# EAGLE design klavesnica (EAGLE 9.6.2)
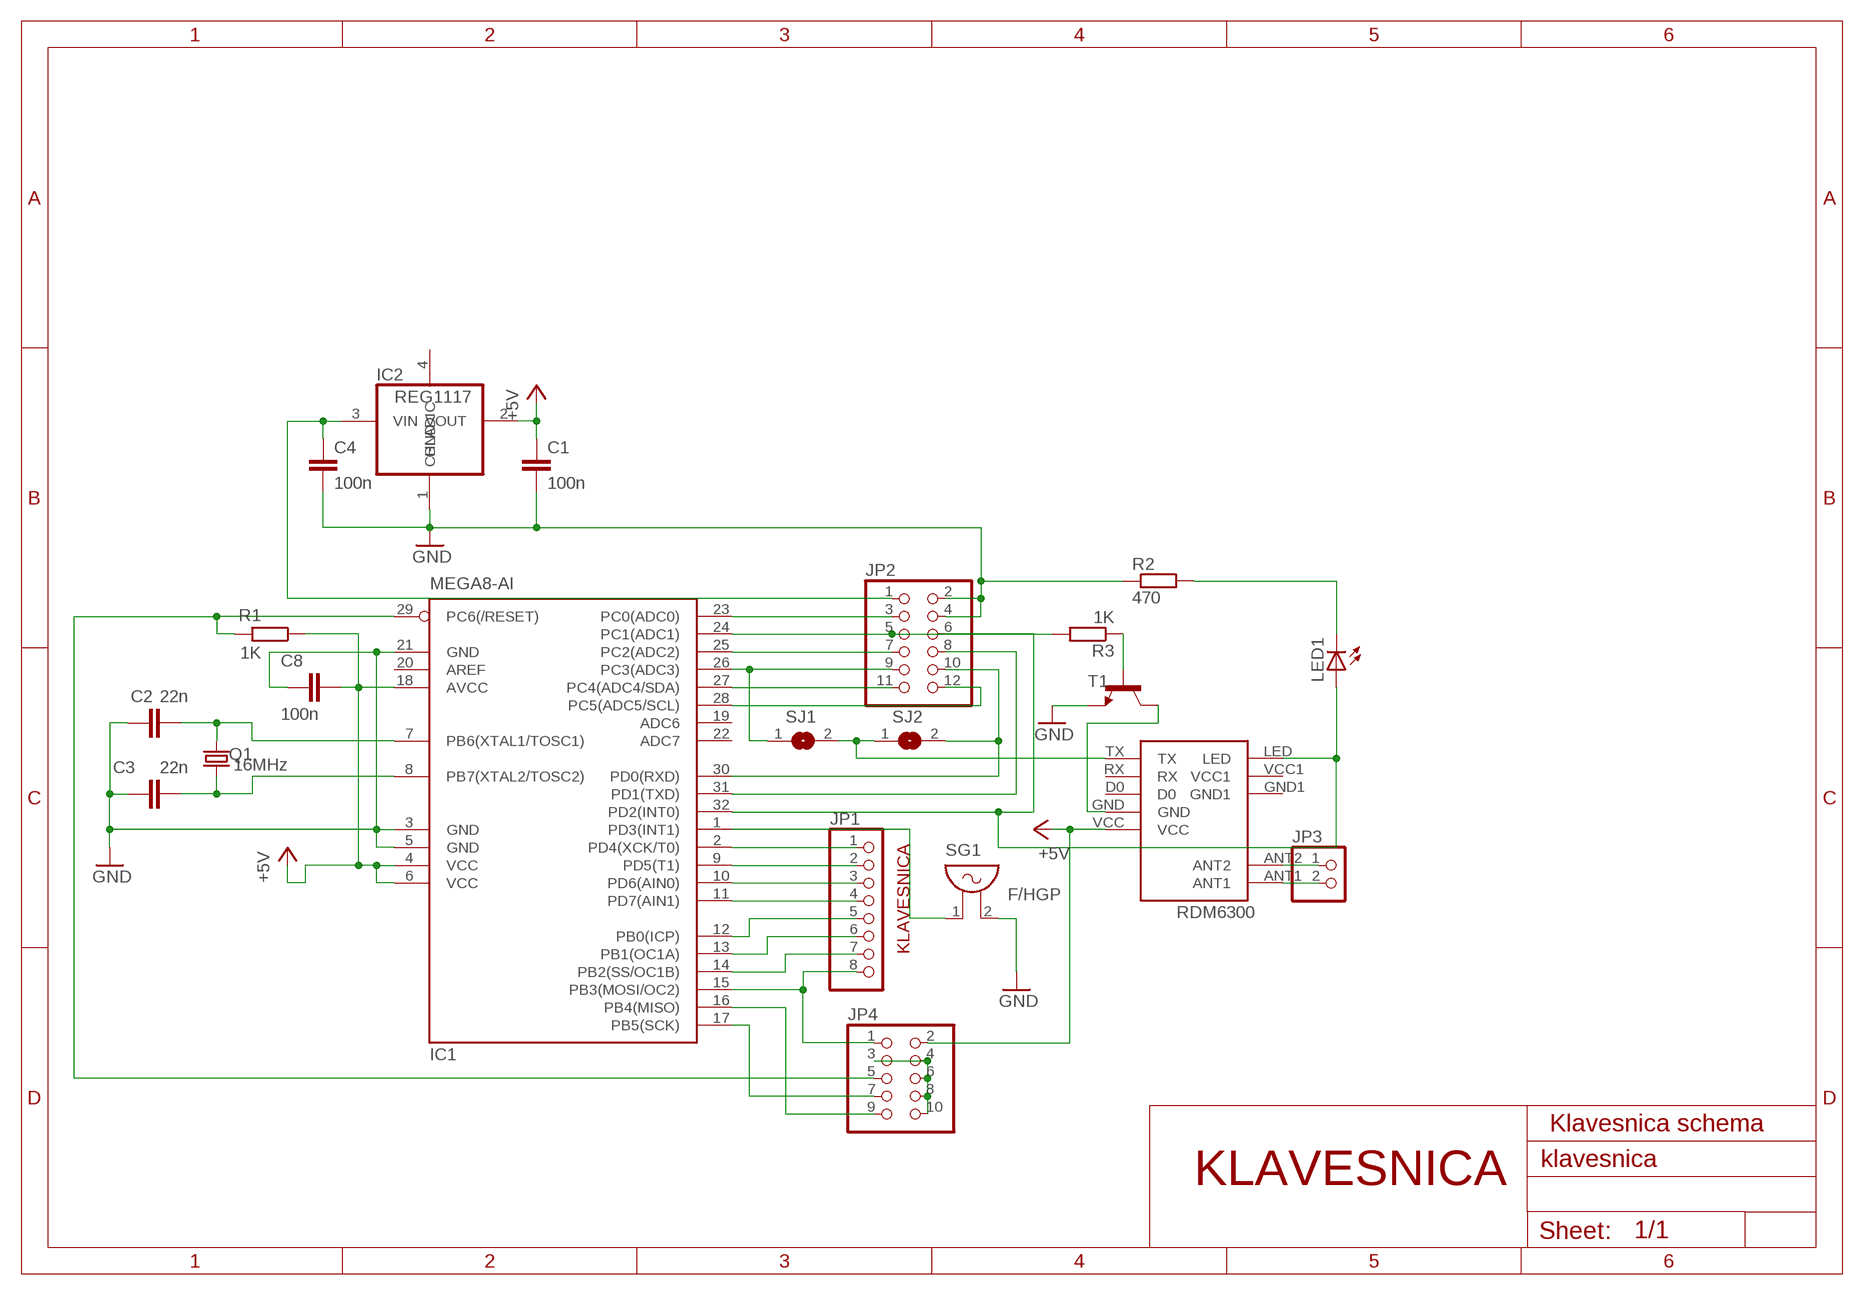
[diagram p0: schematic, sheet 1]

## Parts
C1  100n  C-EUC0805  [C0805]
C2  22n  C-EUC0805  [C0805]
C3  22n  C-EUC0805  [C0805]
C4  100n  C-EUC0805  [C0805]
C8  100n  C-EUC0805  [C0805]
IC1  MEGA8-AI  [TQFP32-08]
IC2  REG1117  [SOT223]
JP1  PINHD-1X8  [1X08]
JP2  PINHD-2X6  [2X06]
JP3  PINHD-1X2  [1X02]
JP4  PINHD-2X5  [2X05]
LED1  LED3MM  [LED3MM]
Q1  16MHz  CRYSTALHC49UP  [HC49UP]
R1  1K  R-EU_R0805  [R0805]
R2  470  R-EU_R0805  [R0805]
R3  1K  R-EU_R0805  [R0805]
RDM1  RDM6300  [RDM6300]
SG1  F/HGP  [F/HGP]
SJ1  SJ  [SJ]
SJ2  SJ  [SJ]
T1  BC808-NPN-SOT23-BEC  [SOT23-BEC]

## Nets
+5V: C1.1 C8.1 IC1.4(VCC) IC1.6(VCC) IC1.18(AVCC) IC2.2(VOUT) JP4.2 R1.1 RDM1.VCC
GND: C1.2 C2.1 C3.1 C4.2 C8.2 IC1.3(GND) IC1.5(GND) IC1.21(GND) IC2.1(GND) JP2.2 JP2.4 R2.1 SG1.2 T1.E
N$1: IC1.29(PC6(/RESET)) JP4.5 R1.2
N$2: IC1.2(PD4(XCK/T0)) JP1.1
N$3: IC1.9(PD5(T1)) JP1.2
N$4: IC1.10(PD6(AIN0)) JP1.3
N$5: IC1.11(PD7(AIN1)) JP1.4
N$6: IC1.12(PB0(ICP)) JP1.5
N$7: IC1.13(PB1(OC1A)) JP1.6
N$8: IC1.14(PB2(SS/OC1B)) JP1.7
N$9: C3.2 IC1.8(PB7(XTAL2/TOSC2)) Q1.1
N$10: C4.1 IC2.3(VIN) JP2.1
N$11: LED1.K(C) R2.2
N$12: C2.2 IC1.7(PB6(XTAL1/TOSC1)) Q1.2
N$13: IC1.23(PC0(ADC0)) JP2.3
N$14: IC1.24(PC1(ADC1)) JP2.5 R3.2
N$15: IC1.25(PC2(ADC2)) JP2.7
N$16: IC1.26(PC3(ADC3)) JP2.9 SJ1.1
N$17: IC1.27(PC4(ADC4/SDA)) JP2.11
N$18: IC1.28(PC5(ADC5/SCL)) JP2.12
N$19: IC1.30(PD0(RXD)) JP2.10 SJ2.2
N$20: IC1.31(PD1(TXD)) JP2.8
N$21: IC1.1(PD3(INT1)) SG1.1
N$22: JP3.1 RDM1.ANT2
N$23: JP3.2 RDM1.ANT1
N$24: JP4.3 JP4.4 JP4.6 JP4.8 JP4.10
N$25: IC1.32(PD2(INT0)) JP2.6 LED1.A RDM1.LED
N$26: IC1.16(PB4(MISO)) JP4.9
N$27: IC1.17(PB5(SCK)) JP4.7
N$28: RDM1.GND T1.C
N$29: IC1.15(PB3(MOSI/OC2)) JP1.8 JP4.1
N$30: R3.1 T1.B
N$31: RDM1.TX SJ1.2 SJ2.1
Unconnected: IC1.19(ADC6) IC1.20(AREF) IC1.22(ADC7) RDM1.D0 RDM1.GND1 RDM1.RX RDM1.VCC1

## Notes on the sheet
- KLAVESNICA
- Klavesnica schema
- KLAVESNICA

## Power pins joined to a net without a drawn wire
CHLADIC: IC2.4(CHLADIC)

## Library data of the parts
C1-C4 C8 = rcl:C-EU: CAPACITOR, European symbol; SPICEPREFIX: C
IC1 = atmel:MEGA8: MICROCONTROLLER 8 Kbytes FLASH, 1 kbytes SRAM, 512 bytes EEPROM, USART, 6-channel 10 bit ADC, 2-channel 8 bit ADC Pin compatible with Atmega48, ATMega88, ATMega168 Source: avr.lbr; MPN: ATMEGA8-16AU; OC_FARNELL: 9171371; OC_NEWARK: 73M8863
IC2 = burr-brown:REG1117: 800mA and 1A Low Dropout (LDO) Positive Regulator 1.8V, 2.5V, 2.85V, 3.3V, 5V, and Adj; MPN: REG1117; OC_FARNELL: 1097566; OC_NEWARK: 14P6981
JP1 = pinhead:PINHD-1X8: PIN HEADER
JP2 = pinhead:PINHD-2X6: PIN HEADER
JP3 = pinhead:PINHD-1X2: PIN HEADER
JP4 = pinhead:PINHD-2X5: PIN HEADER
LED1 = adafruit:LED: LED OSRAM: - CHIPLED LG R971, LG N971, LY N971, LG Q971, LY Q971, LO R971, LY R971 LH N974, LH R974 LS Q976, LO Q976, LY Q976 LO Q996 - Hyper CHIPLED LW Q18S LB Q993, LB Q99A, LB R99A - SideLED LS A670, LO A670, LY A670, LG A670, LP A670 LB A673, LV A673, LT A673, LW A673 LH A674 LY A675 LS A676, LA A676, LO A676, LY A676, LW A676 LS A679, LY A679, LG A679 - Hyper Micro SIDELED® LS Y876, LA Y876, LO Y876, LY Y876 LT Y87S - SmartLED LW L88C, LW L88S LB L89C, LB L89S, LG L890 LS L89K, LO L89K, LY L89K LS L896, LA L896, LO L896, LY L896 - TOPLED LS T670, LO T670, LY T670, LG T670, LP T670 LSG T670, LSP T670, LSY T670, LOP T670, LYG T670 LG T671, LOG T671, LSG T671 LB T673, LV T673, LT T673, LW T673 LH T674 LS T676, LA T676, LO T676, LY T676, LB T676, LH T676, LSB T676, LW T676 LB T67C, LV T67C, LT T67C, LS T67K, LO T67K, LY T67K, LW E67C LS E67B, LA E67B, LO E67B, LY E67B, LB E67C, LV E67C, LT E67C LW T67C LS T679, LY T679, LG T679 LS T770, LO T770, LY T770, LG T770, LP T770 LB T773, LV T773, LT T773, LW T773 LH T774 LS E675, LA E675, LY E675, LS T675 LS T776, LA T776, LO T776, LY T776, LB T776 LHGB T686 LT T68C, LB T68C - Hyper Mini TOPLED® LB M676 - Mini TOPLED Santana® LG M470 LS M47K, LO M47K, LY M47K Source: http://www.osram.convergy.de/
Q1 = crystal:CRYSTAL: CRYSTAL; OC_FARNELL: unknown; OC_NEWARK: unknown
R1-R3 = rcl:R-EU_: RESISTOR, European symbol; SPICEPREFIX: R
RDM1 = RDM6300:RDM6300: 125kHz RFID Reader Module; AVAILABILITY: Unavailable; DESCRIPTION: RDM6300 125KHz cardreader mini-module is designed for reading code from 125KHz card compatible read-only tags and read/write card.; MF: ITEAD; MP: RDM6300; PACKAGE: Package; PRICE: None
SG1 = buzzer:F/HGP: BUZZER Source: Buerklin; OC_FARNELL: unknown; OC_NEWARK: unknown
SJ1 SJ2 = jumper:SJ: SMD solder JUMPER
T1 = transistor-neu-to92:*-NPN-: NPN Transistror

## Board
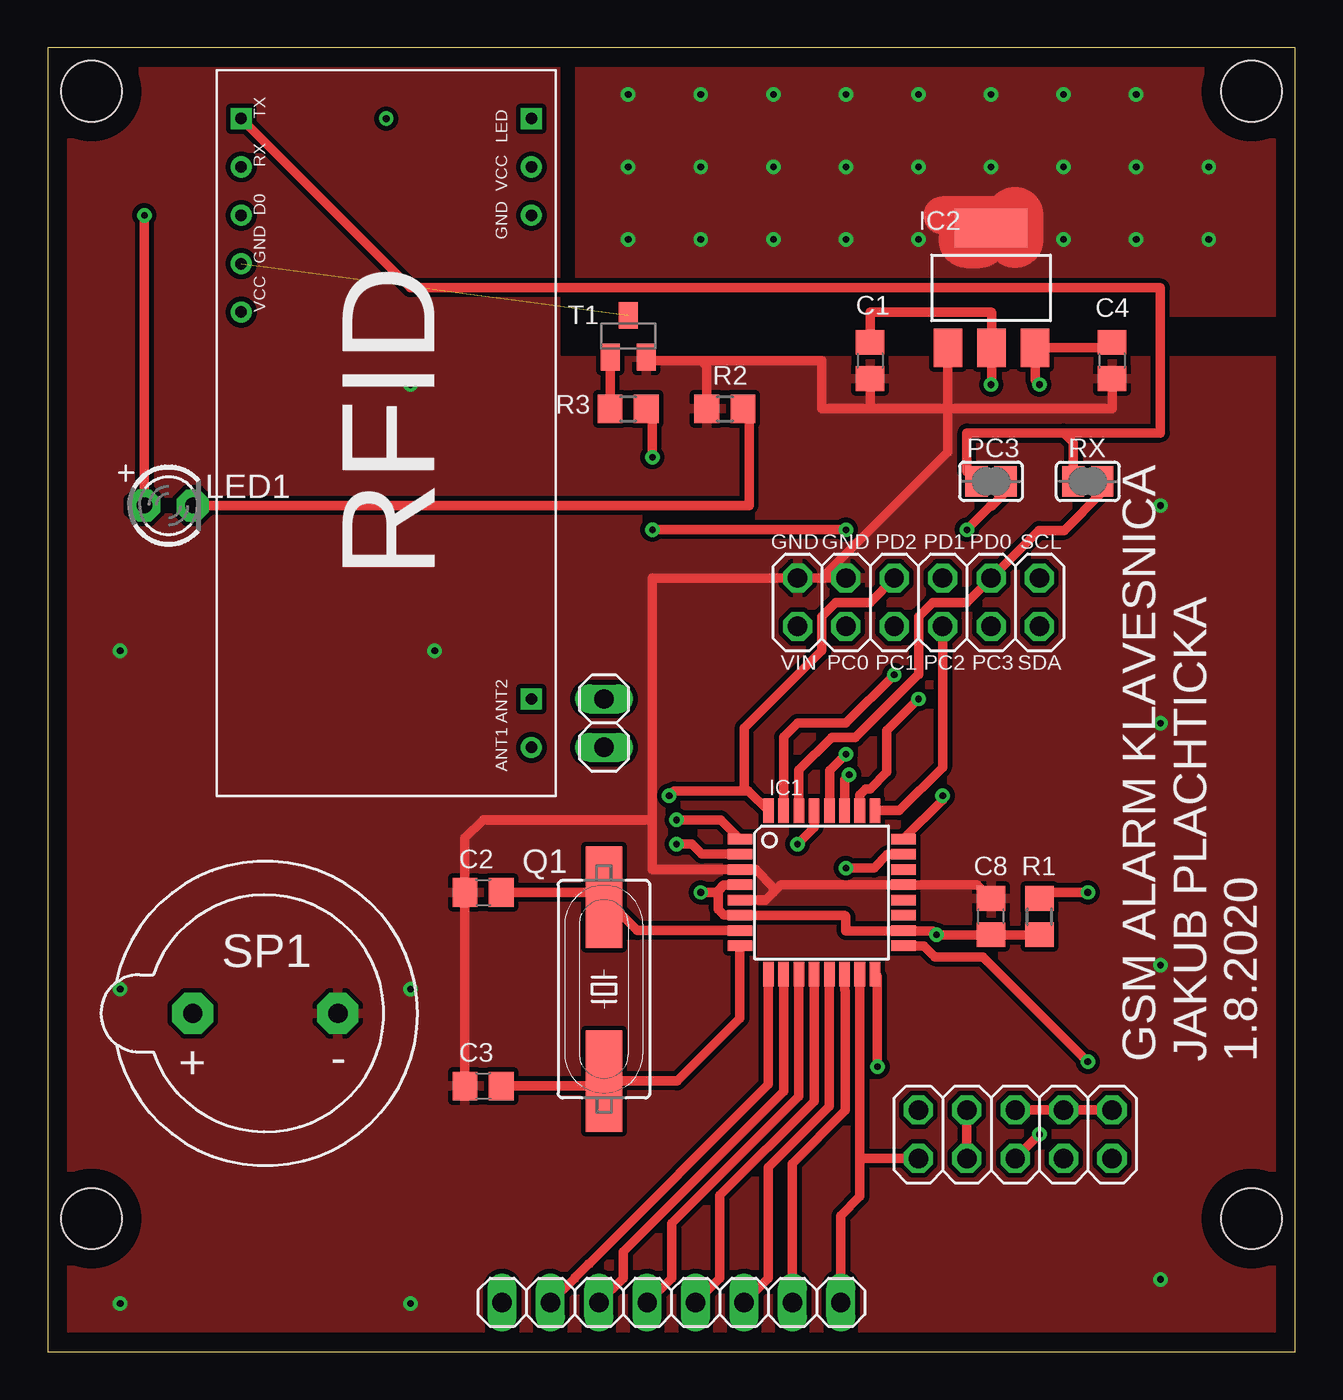
[diagram p1: board, top side]
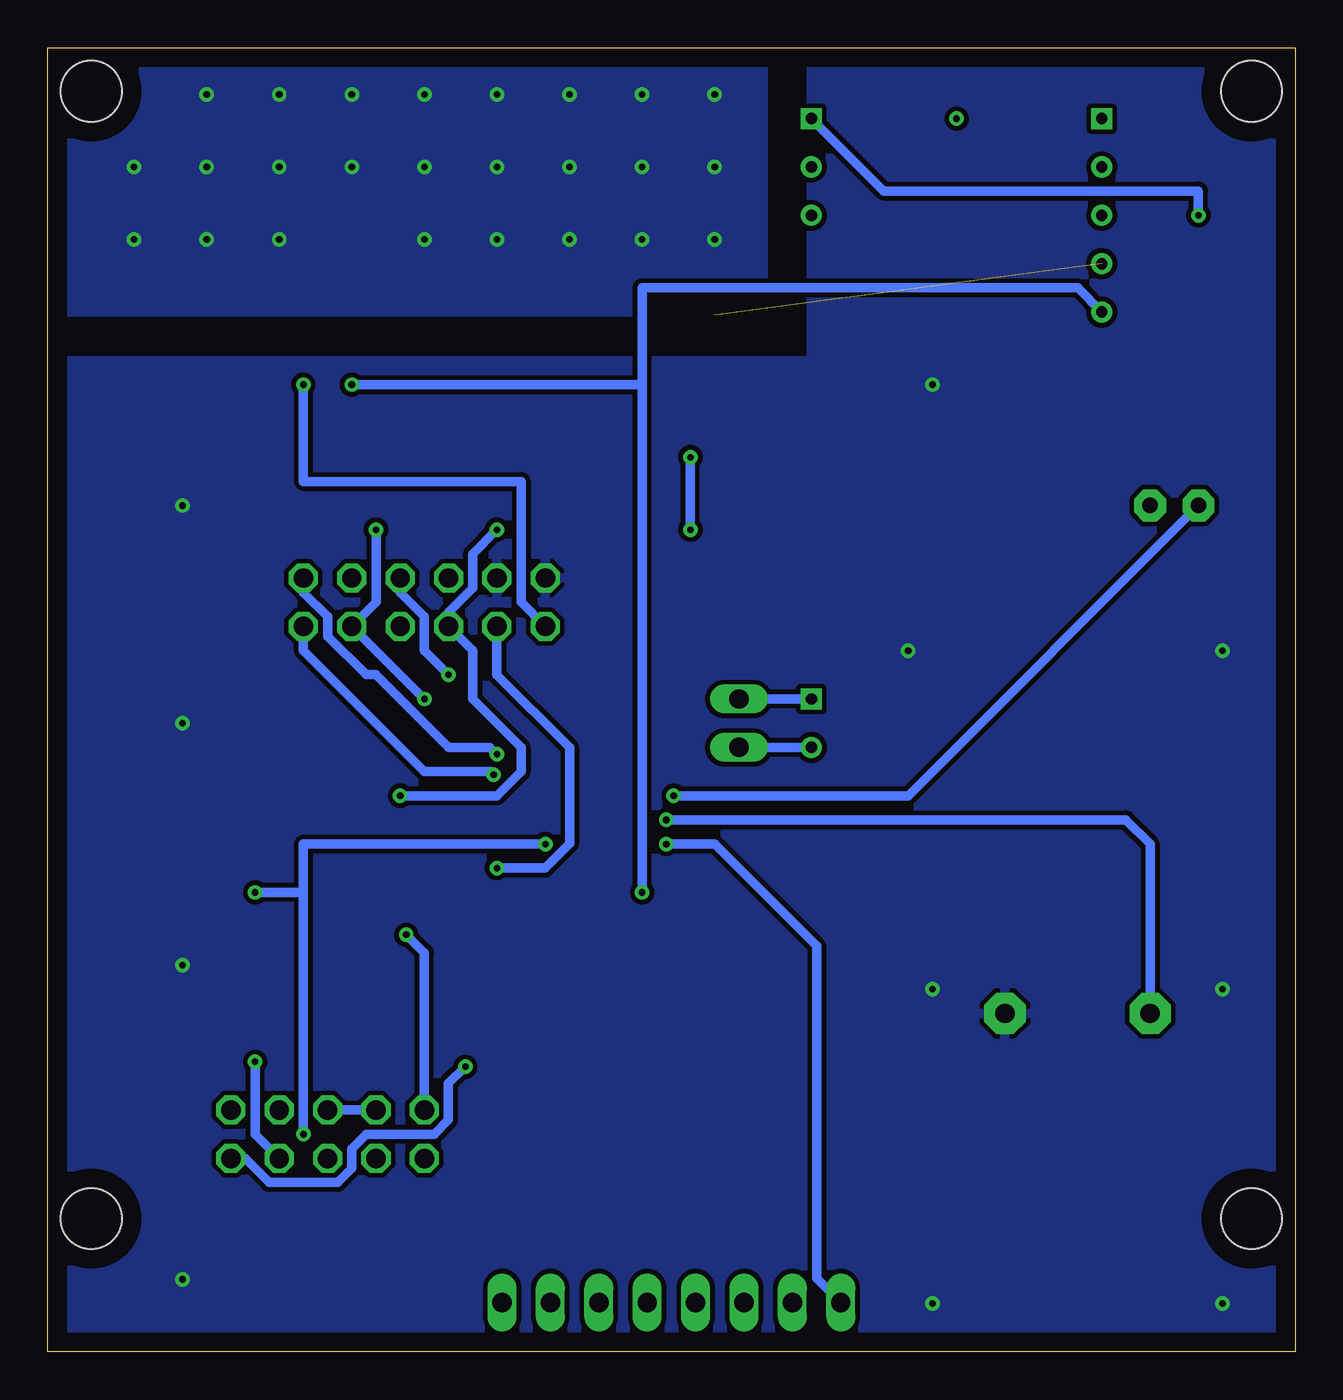
[diagram p2: board, bottom side, seen from below]

Size 65.5 x 68.5 mm. Coordinates in mm from the lower left corner, seen from the top.
Outline: 0,0 65.5,0 65.5,68.5 0,68.5 0,0
Copper layers (1*16): Top 0.035mm / dielectric 1.5mm / Bottom 0.035mm
Design rules "default *": minimum track width 6mil, minimum drill 0.35mm, track to track 10mil, track to pad 10mil, pad to pad 6mil, via to via 6mil, smd to smd 6mil, copper to edge 40mil, drill to drill 6mil, minimum pad ring 10mil, minimum via ring 8mil, stop-mask expansion 4mil, vias tented up to drill 0mil, thermal gap 10mil
Holes 3.2 mm at 2.3,66.2 63.2,66.2 2.3,7 63.2,7

### Footprints (pad centres in the part's own frame; a part is rotated, then mirrored left to right if it is on the bottom)
C0805 = smd 1.3 x 1.5: 1 -0.95,0; 2 0.95,0
TQFP32-08 = smd 1.27 x 0.559: 1 -4.293,2.8; 2 -4.293,2; 3 -4.293,1.2; 4 -4.293,0.4; 5 -4.293,-0.4; 6 -4.293,-1.2; 7 -4.293,-2; 8 -4.293,-2.8; 17 4.293,-2.8; 18 4.293,-2; 19 4.293,-1.2; 20 4.293,-0.4; 21 4.293,0.4; 22 4.293,1.2; 23 4.293,2; 24 4.293,2.8 | smd 0.559 x 1.27: 9 -2.8,-4.293; 10 -2,-4.293; 11 -1.2,-4.293; 12 -0.4,-4.293; 13 0.4,-4.293; 14 1.2,-4.293; 15 2,-4.293; 16 2.8,-4.293; 25 2.8,4.293; 26 2,4.293; 27 1.2,4.293; 28 0.4,4.293; 29 -0.4,4.293; 30 -1.2,4.293; 31 -2,4.293; 32 -2.8,4.293
SOT223 = smd 1.499 x 2.007: 1 -2.261,-3.15; 2 0.025,-3.15; 3 2.311,-3.15 | smd 3.81 x 2.007: 4 0,3.15
1X08 = drill 1.016 long: 1 -8.89,0; 2 -6.35,0; 3 -3.81,0; 4 -1.27,0; 5 1.27,0; 6 3.81,0; 7 6.35,0; 8 8.89,0
2X06 = drill 1.016 octagon: 1 -6.35,-1.27; 2 -6.35,1.27; 3 -3.81,-1.27; 4 -3.81,1.27; 5 -1.27,-1.27; 6 -1.27,1.27; 7 1.27,-1.27; 8 1.27,1.27; 9 3.81,-1.27; 10 3.81,1.27; 11 6.35,-1.27; 12 6.35,1.27
1X02 = drill 1.016 long: 1 -1.27,0; 2 1.27,0
2X05 = drill 1.016 octagon: 1 -5.08,-1.27; 2 -5.08,1.27; 3 -2.54,-1.27; 4 -2.54,1.27; 5 0,-1.27; 6 0,1.27; 7 2.54,-1.27; 8 2.54,1.27; 9 5.08,-1.27; 10 5.08,1.27
LED3MM = drill 0.813 pad 1.676 octagon: A -1.27,0; K 1.27,0
HC49UP = smd 5.334 x 1.93: 1 -4.826,0; 2 4.826,0
R0805 = smd 1.3 x 1.5: 1 -0.95,0; 2 0.95,0
RDM6300 = drill 0.6: ANT1 -16.51,-7.62; D0 11.43,7.62; GND 8.89,7.62; GND1 11.43,-7.62; RX 13.97,7.62; VCC 6.35,7.62; VCC1 13.97,-7.62 | drill 0.6 square: ANT2 -13.97,-7.62; LED 16.51,-7.62; TX 16.51,7.62
F/HGP = drill 1.016 pad 2.159 octagon: 1 -3.81,0; 2 3.81,0
SJ = smd 1.168 x 1.6: 1 -0.762,0; 2 0.762,0
SOT23-BEC = smd 1 x 1.4: B -0.95,-1.1; C 0,1.1; E 0.95,-1.1

### Placement (x,y rotation side)
C1  43.18,52.07 270 top
C2  22.86,24.13 0 top
C3  22.86,13.97 0 top
C4  55.88,52.07 270 top
C8  49.53,22.86 90 top
IC1  40.64,24.13 0 top
IC2  49.53,55.88 0 top
JP1  32.75,2.6 0 top
JP2  45.72,39.37 0 top
JP3  29.21,33.02 270 top
JP4  50.8,11.43 0 top
LED1  6.35,44.45 0 top
Q1  29.21,19.05 90 top
R1  52.07,22.86 90 top
R2  35.56,49.53 0 top
R3  30.48,49.53 0 top
RDM1  17.78,48.26 90 top
SG1  11.43,17.78 0 top
SJ1  49.53,45.72 180 top
SJ2  54.61,45.72 0 top
T1  30.48,53.34 0 top

### Tracks (layer width: path | path; a pad name or v marks a point on that pad's centre or on a via)
+5V  (via drill 0.35)
  Top 0.5: IC1.18 44.92,22.11 | 44.92,22.11 41.91,22.11 41.91,22.86 41.84,22.93 IC1.6 36.33,22.95 35.5,22.95 35.21,23.24 35.21,24.13 | 44.92,22.11 46.47,22.11 v46.67,21.91 C8.1 R1.1 | 35.21,24.13 35.21,24.22 35.5,24.51 36.33,24.51 IC1.4 | 35.21,24.13 v34.29,24.13 | v49.53,50.8 49.55,50.83 IC2.2 49.55,54.59 49.53,54.61 43.18,54.61 C1.1
  Bottom 0.5: v49.53,50.8 34.29,50.8 | v34.29,24.13 34.29,50.8 | 34.29,50.8 34.29,55.88 11.43,55.88 RDM1.VCC | JP4.2 45.72,20.96 v46.67,21.91
CHLADIC  (via drill 0.35)
  Top 2: 50.8,59.69 46.99,59.69
  Top 3: 48.26,58.42 48.92,58.42 IC2.4 50.19,59.03 50.8,58.42 50.8,59.69
  other vias: 30.48,66.04 34.29,66.04 30.48,62.23 30.48,58.42 34.29,62.23 34.29,58.42 38.1,66.04 38.1,62.23 38.1,58.42 41.91,66.04 41.91,62.23 41.91,58.42 45.72,66.04 45.72,62.23 45.72,58.42 49.53,66.04 49.53,62.23 53.34,62.23 53.34,58.42 53.34,66.04 57.15,66.04 57.15,62.23 57.15,58.42 60.96,62.23 60.96,58.42
  pour Top: 66.04,54.61 27.94,54.61 27.94,68.58 66.04,68.58
  pour Bottom: 27.94,68.58 27.94,54.61 66.04,54.61 66.04,68.58
GND  (via drill 0.35)
  Top 0.5: IC1.5 37.7,23.73 38.1,24.13 | 38.1,24.13 38.5,24.53 IC1.21 48.81,24.53 C8.2 | 38.1,24.13 38.1,24.41 37.17,25.33 IC1.3 31.75,25.33 31.75,27.94 | JP2.4 40.64,40.64 | 40.64,40.64 JP2.2 31.75,40.64 31.75,27.94 | IC2.1 47.27,49.53 | 47.27,49.53 47.27,47.27 40.64,40.64 | C3.1 21.91,23.81 21.59,24.13 C2.1 21.91,26.99 22.86,27.94 31.75,27.94 | C1.2 43.18,49.53 | 47.27,49.53 43.18,49.53 | 47.27,49.53 55.88,49.53 C4.2 | T1.E 31.6,52.07 34.29,52.07 | 34.29,52.07 34.61,51.75 R2.1 | 34.29,52.07 40.64,52.07 40.64,49.53 43.18,49.53
  other vias: 58.42,44.45 58.42,33.02 58.42,20.32 58.42,3.81 19.05,2.54 19.05,19.05 3.81,19.05 3.81,2.54 19.05,50.8 3.81,36.83 20.32,36.83
  pour Bottom: 0,68.58 25.4,68.58 25.4,52.07 66.04,52.07 66.04,1.27 64.77,0 0,0
  pour Top: 0,68.58 26.67,68.58 26.67,52.07 66.04,52.07 66.04,0 0,0
N$1  (via drill 0.35)
  Top 0.5: JP4.5 v52.07,11.43 | v54.61,24.13 52.39,24.13 R1.2 | v39.37,26.67 40.24,27.54 IC1.29
  Bottom 0.5: 52.07,24.13 v52.07,11.43 | 52.07,24.13 v54.61,24.13 | v39.37,26.67 52.07,26.67 52.07,24.13
N$2  (via drill 0.35)
  Top 0.5: IC1.2 36.33,26.15 34.35,26.15 33.82,26.67 v33.02,26.67
  Bottom 0.5: JP1.1 25.13,3.87 25.13,21.32 30.48,26.67 v33.02,26.67
N$3
  Top 0.5: JP1.2 27.67,3.87 27.67,3.89 28.42,4.63 28.43,4.63 37.84,14.04 IC1.9
N$4
  Top 0.5: IC1.10 38.64,13.7 30.21,5.27 30.21,3.87 JP1.3
N$5
  Top 0.5: IC1.11 39.44,13.43 32.75,6.74 32.75,3.87 JP1.4
N$6
  Top 0.5: IC1.12 40.24,13.16 35.29,8.22 35.29,3.87 JP1.5
N$7
  Top 0.5: IC1.13 41.04,12.9 37.83,9.69 37.83,3.87 JP1.6
N$8
  Top 0.5: JP1.7 39.1,9.89 41.89,12.68 41.89,18.96 41.86,18.99 41.86,19.82 IC1.14
N$9
  Top 0.5: IC1.8 36.35,17.52 33.05,14.22 Q1.1 28.96,13.97 C3.2
N$10  (via drill 0.35)
  Top 0.5: C4.1 55.59,52.73 IC2.3 51.84,51.03 v52.07,50.8
  Bottom 0.5: JP2.1 40.64,39.37 40.64,45.72 52.07,45.72 v52.07,50.8
N$11
  Top 0.5: LED1.K 36.83,44.45 36.83,49.21 R2.2
N$12
  Top 0.5: IC1.7 30.96,22.13 Q1.2 28.96,24.13 C2.2
N$13  (via drill 0.35)
  Top 0.5: IC1.23 44.92,26.11 44.09,26.11 43.39,25.41 v41.91,25.41
  Bottom 0.5: v41.91,25.41 39.38,25.41 39.01,25.79 38.1,26.69 38.1,31.75 41.91,35.56 JP2.3
N$14  (via drill 0.35)
  Top 0.5: v41.91,43.18 v31.75,43.18 | v31.75,46.99 31.75,49.21 R3.2 | v46.99,29.21 46.99,28.99 IC1.24
  Bottom 0.5: v41.91,43.18 43.18,41.91 43.18,40.12 44.45,38.85 JP2.5 43.18,36.83 43.18,34.29 40.64,31.75 40.64,30.48 41.91,29.21 v46.99,29.21 | v31.75,43.18 v31.75,46.99
N$15
  Top 0.5: IC1.25 44.71,28.42 46.99,30.7 JP2.7
N$16  (via drill 0.35)
  Top 0.5: v45.72,34.29 44.06,32.63 44.06,30.44 43.18,29.56 42.95,29.56 42.64,29.25 IC1.26 | v48.26,43.18 49.5,44.42 49.56,44.42 50.29,45.15 SJ1.1
  Bottom 0.5: v45.72,34.29 JP2.9 48.26,39.37 v48.26,43.18
N$17  (via drill 0.35)
  Top 0.5: IC1.27 41.84,30.07 v42.08,30.31
  Bottom 0.5: v42.08,30.31 42.25,30.48 45.72,30.48 52.07,36.83 JP2.11
N$18  (via drill 0.35)
  Top 0.5: IC1.28 41.06,28.44 41.06,30.53 v41.91,31.38
  Bottom 0.5: v41.91,31.38 42.28,31.75 44.45,31.75 48.26,35.56 48.78,35.56 50.8,37.58 50.8,38.62 52.07,39.89 JP2.12
N$19
  Top 0.5: IC1.30 39.44,30.55 41.16,32.27 42.4,32.27 45.7,35.56 45.72,35.56 45.72,38.62 46.47,39.37 48.26,39.37 JP2.10 52.04,43.15 53.37,43.15 55.37,45.15 SJ2.2
N$20  (via drill 0.35)
  Top 0.5: IC1.31 38.64,32.29 39.37,33.02 41.91,33.02 v44.45,35.56
  Bottom 0.5: v44.45,35.56 45.72,36.83 45.72,38.62 46.99,39.89 JP2.8
N$21  (via drill 0.35)
  Top 0.5: IC1.1 35.34,27.94 v33.02,27.94
  Bottom 0.5: v33.02,27.94 8.89,27.94 7.62,26.67 SG1.1
N$22
  Bottom 0.5: RDM1.ANT2 JP3.1
N$23
  Bottom 0.5: RDM1.ANT1 JP3.2
N$24
  Top 0.5: JP4.10 JP4.8 JP4.6 | JP4.4 JP4.3
  Bottom 0.5: JP4.6 JP4.4
N$25  (via drill 0.35)
  Top 0.5: v5.08,59.69 LED1.A | 36.57,29.47 36.57,32.76 40.64,36.83 40.64,38.62 41.39,39.37 43.18,39.37 JP2.6 | v32.63,29.21 32.89,29.47 36.57,29.47 | 36.57,29.47 36.79,29.47 IC1.32
  Bottom 0.5: LED1.A 20.32,29.21 v32.63,29.21 | v5.08,59.69 5.08,60.96 21.59,60.96 RDM1.LED
N$26  (via drill 0.35)
  Top 0.5: IC1.16 43.57,19.71 v43.57,14.98
  Bottom 0.5: v43.57,14.98 44.45,14.09 44.45,12.18 45.2,11.43 48.78,11.43 49.53,10.68 49.53,9.64 50.28,8.89 53.86,8.89 55.13,10.16 JP4.9
N$27  (via drill 0.35)
  Top 0.5: IC1.17 45.72,21.33 45.98,21.33 46,21.33 46.58,20.76 49.09,20.76 v54.61,15.24
  Bottom 0.5: JP4.7 54.61,11.43 v54.61,15.24
N$28  (1 unrouted)
N$29
  Top 0.5: IC1.15 42.64,10.16 | 42.64,10.16 42.64,8.16 41.64,7.16 JP1.8 | JP4.1 42.64,10.16
N$30
  Top 0.5: R3.1 T1.B
N$31
  Top 0.5: SJ1.2 48.26,46.23 48.26,48.26 53.34,48.26 | 53.34,48.26 53.85,47.75 SJ2.1 | 53.34,48.26 58.42,48.26 58.42,55.88 19.05,55.88 RDM1.TX
N$34  (via drill 0.35)
  other vias: 17.78,64.77

### Text on the board
tNames: PC3 | RX | GND | GND | PD2 | PD1 | PD0 | SCL | RFID | VIN | PC0 | PC1 | PC2 | PC3 | SDA | SP1 | - | GSM ALARM KLAVESNICA / JAKUB PLACHTICKA / 1.8.2020 | +